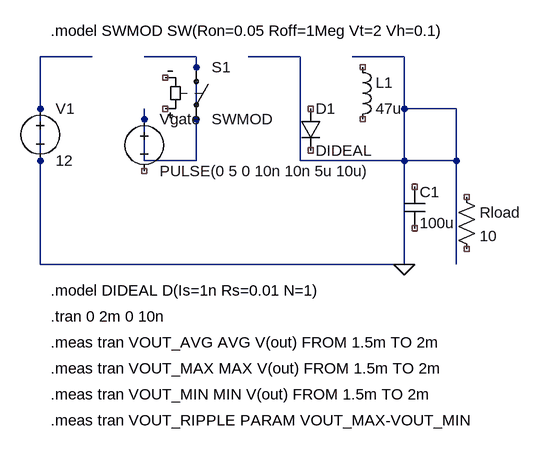
[diagram p0: schematic buck_ideal.asc]
buck_ideal.asc, the LTspice schematic file:
Version 4
SHEET 1 1200 800
WIRE 160 160 240 160
WIRE 320 160 400 160
WIRE 480 160 560 160
WIRE 640 160 720 160
WIRE 720 160 720 240
WIRE 720 240 720 320
WIRE 720 320 720 480
WIRE 160 160 160 480
WIRE 160 480 720 480
WIRE 320 240 320 320
WIRE 320 320 400 320
WIRE 400 320 400 240
WIRE 400 240 400 160
WIRE 560 160 560 240
WIRE 560 240 560 320
WIRE 560 320 720 320
WIRE 720 320 800 320
WIRE 800 320 800 480
WIRE 720 240 800 240
WIRE 800 240 800 320
SYMBOL voltage 160 224 R0
SYMATTR InstName V1
SYMATTR Value 12
SYMBOL sw 400 160 R0
SYMATTR InstName S1
SYMATTR Value SWMOD
SYMBOL voltage 320 240 R0
SYMATTR InstName Vgate
SYMATTR Value PULSE(0 5 0 10n 10n 5u 10u)
SYMBOL diode 560 240 R0
SYMATTR InstName D1
SYMATTR Value DIDEAL
SYMBOL ind 640 160 R0
SYMATTR InstName L1
SYMATTR Value 47u
SYMBOL cap 720 360 R0
SYMATTR InstName C1
SYMATTR Value 100u
SYMBOL res 800 360 R0
SYMATTR InstName Rload
SYMATTR Value 10
FLAG 720 480 0
TEXT 176 120 Left 2 !.model SWMOD SW(Ron=0.05 Roff=1Meg Vt=2 Vh=0.1)
TEXT 176 520 Left 2 !.model DIDEAL D(Is=1n Rs=0.01 N=1)
TEXT 176 560 Left 2 !.tran 0 2m 0 10n
TEXT 176 600 Left 2 !.meas tran VOUT_AVG AVG V(out) FROM 1.5m TO 2m
TEXT 176 640 Left 2 !.meas tran VOUT_MAX MAX V(out) FROM 1.5m TO 2m
TEXT 176 680 Left 2 !.meas tran VOUT_MIN MIN V(out) FROM 1.5m TO 2m
TEXT 176 720 Left 2 !.meas tran VOUT_RIPPLE PARAM VOUT_MAX-VOUT_MIN

The netlist it stands for:
* buck_ideal.asc
V1 0 0 12
S1 N001 N001 NC_01 NC_02 SWMOD
Vgate N001 NC_03 PULSE(0 5 0 10n 10n 5u 10u)
D1 NC_04 NC_05 DIDEAL
L1 NC_06 NC_07 47u
C1 NC_08 NC_09 100u
Rload NC_10 NC_11 10
.model D D
.lib standard.dio
.model SWMOD SW(Ron=0.05 Roff=1Meg Vt=2 Vh=0.1)
.model DIDEAL D(Is=1n Rs=0.01 N=1)
.tran 0 2m 0 10n
.meas tran VOUT_AVG AVG V(out) FROM 1.5m TO 2m
.meas tran VOUT_MAX MAX V(out) FROM 1.5m TO 2m
.meas tran VOUT_MIN MIN V(out) FROM 1.5m TO 2m
.meas tran VOUT_RIPPLE PARAM VOUT_MAX-VOUT_MIN
.backanno
.end